# EAGLE design Esquematico (EAGLE 9.6.2)
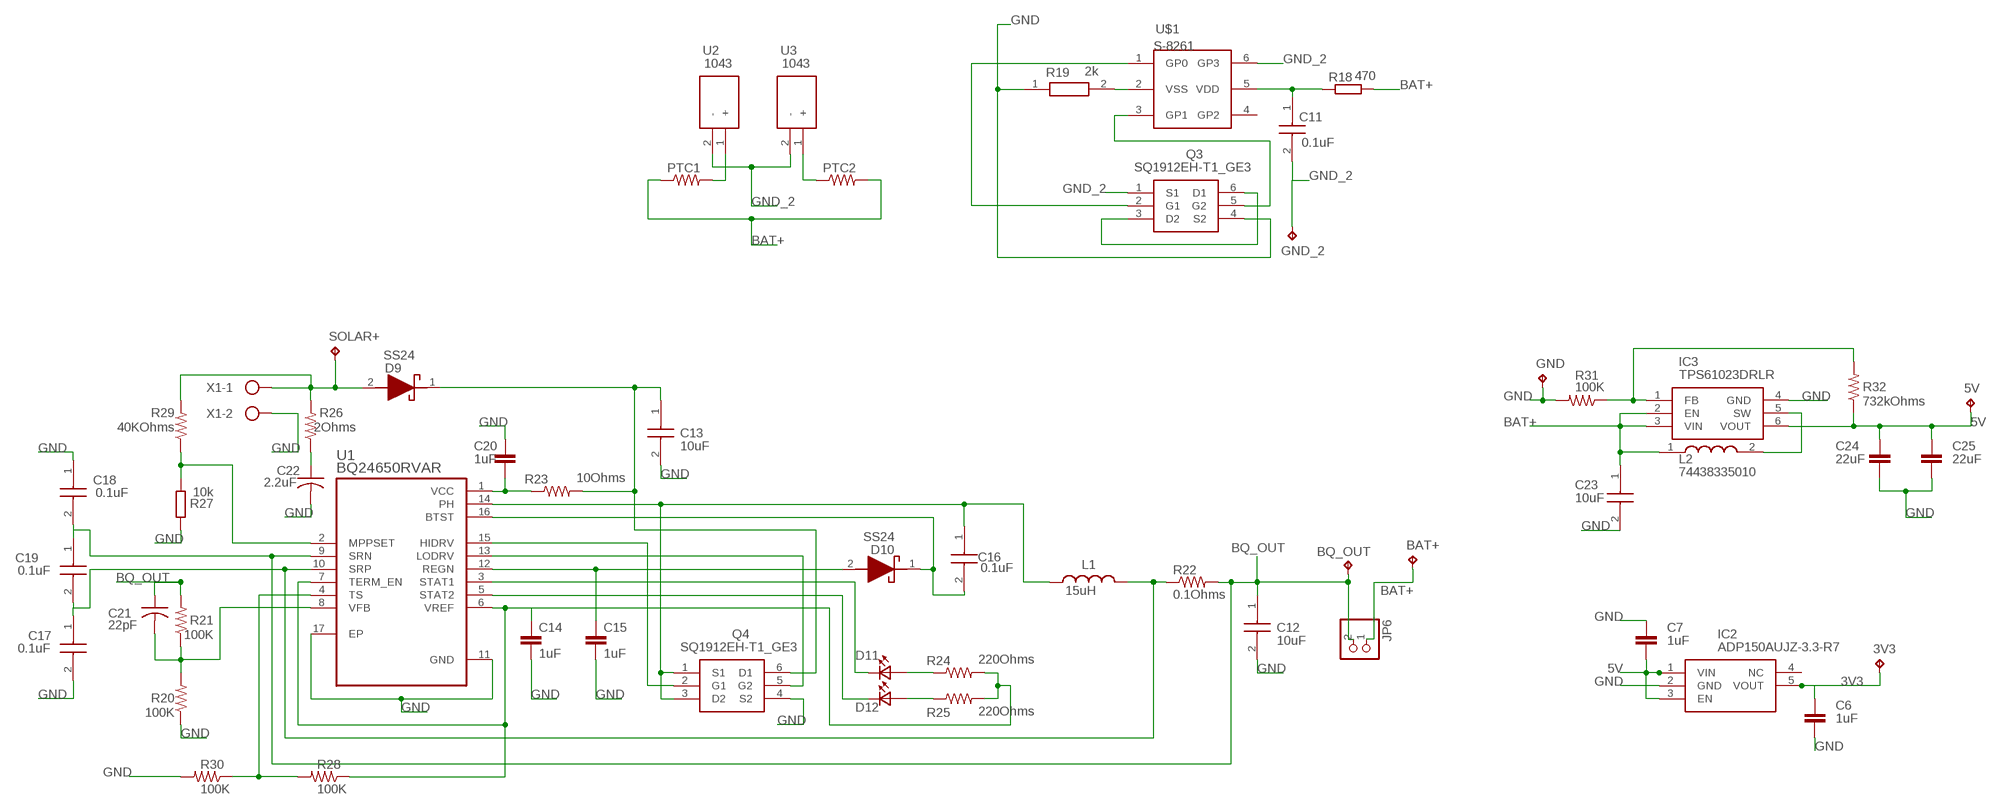
[diagram p0: schematic, sheet 1, part 1 of 2]
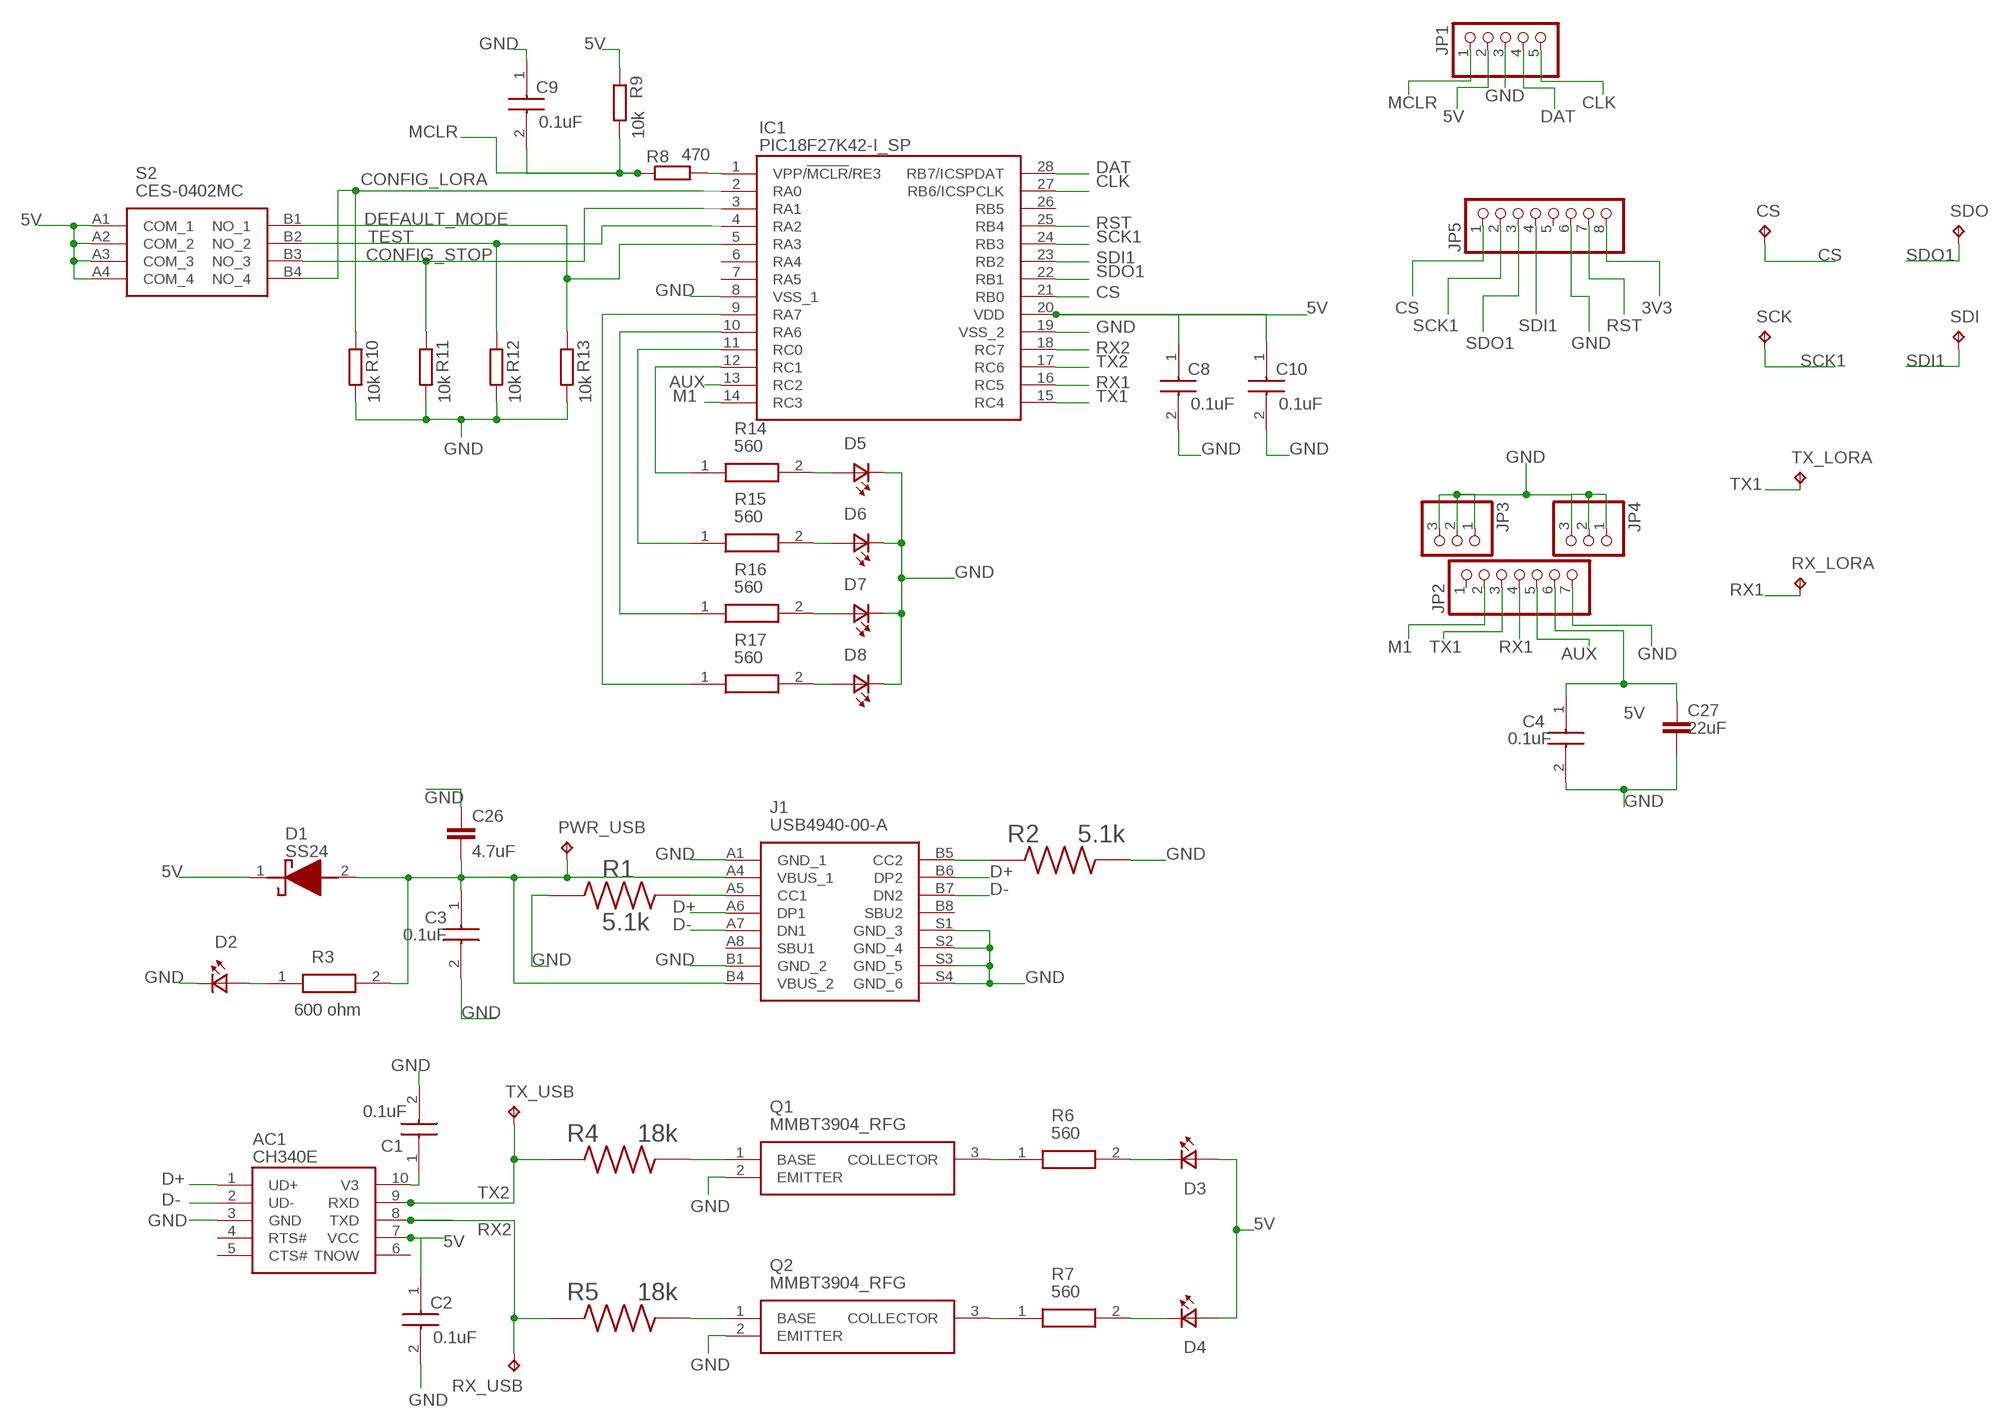
[diagram p1: schematic, sheet 1, part 2 of 2]

## Parts
3V3  TPB1,27  [B1,27]
5V  TPB1,27  [B1,27]
AC1  CH340E  [SOP50P490X100-10N]
BAT+  TPB1,27  [B1,27]
BQ_OUT  TPB1,27  [B1,27]
C1  0.1uF  GRM022C81A104ME05L  [CAPC0402X22N]
C2  0.1uF  GRM022C81A104ME05L  [CAPC0402X22N]
C3  0.1uF  GRM022C81A104ME05L  [CAPC0402X22N]
C4  0.1uF  GRM022C81A104ME05L  [CAPC0402X22N]
C6  1uF  C-EUC0805K  [C0805K]
C7  1uF  C-EUC0805K  [C0805K]
C8  0.1uF  GRM022C81A104ME05L  [CAPC0402X22N]
C9  0.1uF  GRM022C81A104ME05L  [CAPC0402X22N]
C10  0.1uF  GRM022C81A104ME05L  [CAPC0402X22N]
C11  0.1uF  GRM022C81A104ME05L  [CAPC0402X22N]
C12  10uF  0805X7R106KT1AT  [CAPC2013X113N]
C13  10uF  0805X7R106KT1AT  [CAPC2013X113N]
C14  1uF  C-EUC0805K  [C0805K]
C15  1uF  C-EUC0805K  [C0805K]
C16  0.1uF  GRM022C81A104ME05L  [CAPC0402X22N]
C17  0.1uF  GRM022C81A104ME05L  [CAPC0402X22N]
C18  0.1uF  GRM022C81A104ME05L  [CAPC0402X22N]
C19  0.1uF  GRM022C81A104ME05L  [CAPC0402X22N]
C20  1uF  C-EUC0805K  [C0805K]
C21  22pF  C-USC0603  [C0603]
C22  2.2uF  C-USC0603  [C0603]
C23  10uF  0805X7R106KT1AT  [CAPC2013X113N]
C24  22uF  C-EUC1210K  [C1210K]
C25  22uF  C-EUC1210K  [C1210K]
C26  4.7uF  C-EUC0402  [C0402]
C27  22uF  C-EUC1210K  [C1210K]
CS  TPB1,27  [B1,27]
D1  SS24  [DIOM5436X247N]
D2  LTST-C193KGKT-5A  [0603]
D3  LTST-C193KGKT-5A  [0603]
D4  LTST-C193KGKT-5A  [0603]
D5  LTST-C193KGKT-5A  [0603]
D6  LTST-C193KGKT-5A  [0603]
D7  LTST-C193KGKT-5A  [0603]
D8  LTST-C193KGKT-5A  [0603]
D9  SS24  [DIOM5436X247N]
D10  SS24  [DIOM5436X247N]
D11  LTST-C193KGKT-5A  [0603]
D12  LTST-C193KGKT-5A  [0603]
GND  TPB1,27  [B1,27]
GND_2  TPB1,27  [B1,27]
IC1  PIC18F27K42-I_SP  [DIP794W56P254L3486H508Q28N]
IC2  ADP150AUJZ-3.3-R7  [SOT95P280X100-5N]
IC3  TPS61023DRLR  [SOTFL50P160X60-6N]
J1  USB4940-00-A  [USB494000A]
JP1  PINHD-1X5  [1X05]
JP2  PINHD-1X7  [1X07]
JP3  PINHD-1X3  [1X03]
JP4  PINHD-1X3  [1X03]
JP5  PINHD-1X8  [1X08]
JP6  PINHD-1X2  [1X02]
L1  15uH  WE-PD2A_7850_784775115  [WE-PD2A_7850]
L2  74438335010  [INDPM3030X150N]
PTC1  R-US_R0603  [R0603]
PTC2  R-US_R0603  [R0603]
PWR_USB  TPB1,27  [B1,27]
Q1  MMBT3904_RFG  [SOT95P237X112-3N]
Q2  MMBT3904_RFG  [SOT95P237X112-3N]
Q3  SQ1912EH-T1_GE3  [SQ1912EHT1_GE3]
Q4  SQ1912EH-T1_GE3  [SQ1912EHT1_GE3]
R1  5.1k  SR0603KR-075K1L  [RESC1608X55N]
R2  5.1k  SR0603KR-075K1L  [RESC1608X55N]
R3  600 ohm  CRCW0805600RFKEAHP  [RESC2012X60N]
R4  18k  ERJ-P03F1802V  [RESC1608X55N]
R5  18k  ERJ-P03F1802V  [RESC1608X55N]
R6  560  CRCW0603560RFKED  [RESC1608X50N]
R7  560  CRCW0603560RFKED  [RESC1608X50N]
R8  470  R-EU_R1206  [R1206]
R9  10k  R-EU_R1206  [R1206]
R10  10k  R-EU_R1206  [R1206]
R11  10k  R-EU_R1206  [R1206]
R12  10k  R-EU_R1206  [R1206]
R13  10k  R-EU_R1206  [R1206]
R14  560  CRCW0603560RFKED  [RESC1608X50N]
R15  560  CRCW0603560RFKED  [RESC1608X50N]
R16  560  CRCW0603560RFKED  [RESC1608X50N]
R17  560  CRCW0603560RFKED  [RESC1608X50N]
R18  470  R-EU_R1206  [R1206]
R19  2k  CRCW06032K00JNTA  [RESC1608X50N]
R20  100K  R-US_R0402  [R0402]
R21  100K  R-US_R0402  [R0402]
R22  0.1Ohms  R-US_R0805  [R0805]
R23  10Ohms  R-US_R1206W  [R1206W]
R24  220Ohms  R-US_R0402  [R0402]
R25  220Ohms  R-US_R0402  [R0402]
R26  2Ohms  R-US_R2512W  [R2512W]
R27  10k  R-EU_R1206  [R1206]
R28  100K  R-US_R0402  [R0402]
R29  40KOhms  R-US_R0805  [R0805]
R30  100K  R-US_R0402  [R0402]
R31  100K  R-US_R0402  [R0402]
R32  732kOhms  R-US_R0402  [R0402]
RX_LORA  TPB1,27  [B1,27]
RX_USB  TPB1,27  [B1,27]
S2  CES-0402MC  [CES0402MC]
SCK  TPB1,27  [B1,27]
SDI  TPB1,27  [B1,27]
SDO  TPB1,27  [B1,27]
SOLAR+  TPB1,27  [B1,27]
TX_LORA  TPB1,27  [B1,27]
TX_USB  TPB1,27  [B1,27]
U1  BQ24650RVAR  [QFN50P350X350X100-17N]
U2  1043  [1043]
U3  1043  [1043]
U$1  S-8261  10F200T  [SOT23-6]
X1  V+  W237-102  [W237-102]

## Nets
3V3: 3V3.TP C6.1 IC2.5(VOUT) JP5.8
5V: 5V.TP AC1.7(VCC) C2.1 C4.1 C7.2 C8.1 C10.1 C24.1 C25.1 C27.1 D1.1(K) D3.2(A2) D4.2(A2) IC1.20(VDD) IC2.1(VIN) IC2.3(EN) IC3.6(VOUT) JP1.2 JP2.6 R9.1 R32.1 S2.A1(COM_1) S2.A2(COM_2) S2.A3(COM_3) S2.A4(COM_4)
AUX: IC1.13(RC2) JP2.5
BAT+: BAT+.TP C23.1 IC3.2(EN) IC3.3(VIN) JP6.1 L2.1 PTC1.1 PTC2.2 R18.2
BQ_OUT: BQ_OUT.TP C12.1 C18.2 C19.1 C21.1 JP6.2 R21.2 R22.2 U1.9(SRN)
CLK: IC1.27(RB6/ICSPCLK) JP1.5
CONFIG_LORA: IC1.2(RA0) R10.1 S2.B4(NO_4)
CONFIG_STOP: IC1.3(RA1) R11.1 S2.B3(NO_3)
CS: CS.TP IC1.21(RB0) JP5.1
D+: AC1.1(UD+) J1.A6(DP1) J1.B6(DP2)
D-: AC1.2(UD-) J1.A7(DN1) J1.B7(DN2)
DAT: IC1.28(RB7/ICSPDAT) JP1.4
DEFAULT_MODE: IC1.5(RA3) R13.1 S2.B1(NO_1)
GND: AC1.3(GND) C1.2 C2.2 C3.2 C4.2 C6.2 C7.1 C8.2 C9.1 C10.2 C12.2 C13.2 C14.2 C15.2 C17.2 C18.1 C20.1 C22.2 C23.2 C24.2 C25.2 C26.1 C27.2 D2.1(K2) D5.1(K2) D6.1(K2) D7.1(K2) D8.1(K2) GND.TP IC1.8(VSS_1) IC1.19(VSS_2) IC2.2(GND) IC3.4(GND) J1.A1(GND_1) J1.B1(GND_2) J1.S1(GND_3) J1.S2(GND_4) J1.S3(GND_5) J1.S4(GND_6) JP1.3 JP2.7 JP3.1 JP3.2 JP3.3 JP4.1 JP4.2 JP4.3 JP5.6 Q1.2(EMITTER) Q2.2(EMITTER) Q3.4(S2) Q4.4(S2) R1.1 R2.2 R10.2 R11.2 R12.2 R13.2 R19.1 R20.1 R27.1 R30.2 R31.2 U1.11(GND) U1.17(EP) X1.2
GND_2: C11.2 GND_2.TP Q3.1(S1) U2.2(-) U3.2(-) U$1.6(GP3)
M1: IC1.14(RC3) JP2.2
MCLR: C9.2 JP1.1 R8.1 R9.2
N$1: J1.A5(CC1) R1.2
N$2: Q1.1(BASE) R4.2
N$3: C3.1 C26.2 D1.2(A) J1.A4(VBUS_1) J1.B4(VBUS_2) PWR_USB.TP R3.2
N$4: J1.B5(CC2) R2.1
N$6: D2.2(A2) R3.1
N$7: AC1.10(V3) C1.1
N$8: Q2.1(BASE) R5.2
N$9: IC1.9(RA7) R17.1
N$10: IC1.10(RA6) R16.1
N$11: Q1.3(COLLECTOR) R6.1
N$12: IC1.11(RC0) R15.1
N$13: IC1.12(RC1) R14.1
N$14: Q2.3(COLLECTOR) R7.1
N$15: D3.1(K2) R6.2
N$16: D4.1(K2) R7.2
N$17: IC1.1(VPP/!MCLR!/RE3) R8.2
N$18: Q3.2(G1) U$1.1(GP0)
N$19: D5.2(A2) R14.2
N$20: D6.2(A2) R15.2
N$21: D7.2(A2) R16.2
N$22: D8.2(A2) R17.2
N$23: C11.1 R18.1 U$1.5(VDD)
N$24: Q3.5(G2) U$1.3(GP1)
N$25: Q3.3(D2) Q3.6(D1)
N$26: C20.2 R23.1 U1.1(VCC)
N$27: R19.2 U$1.2(VSS)
N$28: C16.1 L1.1 Q4.1(S1) Q4.3(D2) U1.14(PH)
N$29: C17.1 C19.2 L1.2 R22.1 U1.10(SRP)
N$30: C14.1 R24.2 R25.2 R28.1 U1.6(VREF) U1.7(TERM_EN)
N$31: R27.2 R29.1 U1.2(MPPSET)
N$32: R28.2 R30.1 U1.4(TS)
N$33: C16.2 D10.1(K) U1.16(BTST)
N$34: C21.2 R20.2 R21.1 U1.8(VFB)
N$35: C13.1 D9.1(K) Q4.6(D1) R23.2
N$36: D9.2(A) R26.2 R29.2 SOLAR+.TP X1.1
N$37: C22.1 R26.1
N$38: D11.2(A2) R24.1
N$39: D12.2(A2) R25.1
N$40: D11.1(K2) U1.3(STAT1)
N$41: D12.1(K2) U1.5(STAT2)
N$42: C15.1 D10.2(A) U1.12(REGN)
N$43: Q4.2(G1) U1.15(HIDRV)
N$44: Q4.5(G2) U1.13(LODRV)
N$45: PTC1.2 U2.1(+)
N$46: PTC2.1 U3.1(+)
N$47: IC3.5(SW) L2.2
N$48: IC3.1(FB) R31.1 R32.2
RST: IC1.25(RB4) JP5.7
RX1: IC1.16(RC5) JP2.4 RX_LORA.TP
RX2: AC1.8(TXD) IC1.18(RC7) R5.1 RX_USB.TP
SCK1: IC1.24(RB3) JP5.2 SCK.TP
SDI1: IC1.23(RB2) JP5.4 SDI.TP
SDO1: IC1.22(RB1) JP5.3 SDO.TP
TEST: IC1.4(RA2) R12.1 S2.B2(NO_2)
TX1: IC1.15(RC4) JP2.3 TX_LORA.TP
TX2: AC1.9(RXD) IC1.17(RC6) R4.1 TX_USB.TP
Unconnected: AC1.4(RTS#) AC1.5(CTS#) AC1.6(TNOW) IC1.6(RA4) IC1.7(RA5) IC1.26(RB5) IC2.4(NC) J1.A8(SBU1) J1.B8(SBU2) JP2.1 JP5.5 U$1.4(GP2)

## Library data of the parts
3V3 5V BAT+ BQ_OUT CS GND GND_2 PWR_USB RX_LORA RX_USB SCK SDI SDO SOLAR+ TX_LORA TX_USB = testpad:TP: Test pad
AC1 = CH340E:CH340E: USB Serial IC Source: Datasheet <https://akizukidenshi.com/download/ds/wch/ch340.pdf>; DESCRIPTION: USB Serial IC; HEIGHT: 1mm; MANUFACTURER_NAME: WCH; MANUFACTURER_PART_NUMBER: CH340E
C1-C4 C8-C11 C16-C19 = GRM022C81A104ME05L:GRM022C81A104ME05L: 0.1 F +/-20% 10V Ceramic Capacitor X6S 01005 (0402 Metric) Source: Datasheet <https://pim.murata.com/en-eu/pim/details/?partNum=GRM022C81A104ME05#>; DESCRIPTION: 0.1 F +/-20% 10V Ceramic Capacitor X6S 01005 (0402 Metric); HEIGHT: 0.22mm; MANUFACTURER_NAME: Murata Electronics; MANUFACTURER_PART_NUMBER: GRM022C81A104ME05L
C6 C7 C14 C15 C20 C24-C27 = rcl:C-EU: CAPACITOR, European symbol; SPICEPREFIX: C
C12 C13 C23 = 0805X7R106KT1AT:0805X7R106KT1AT: Multilayer Ceramic Capacitors MLCC - SMD/SMT CAP-RESALE Source: Datasheet <https://datasheets.kyocera-avx.com/Accu-P.pdf>; DESCRIPTION: Multilayer Ceramic Capacitors MLCC - SMD/SMT CAP-RESALE; HEIGHT: 1.13mm; MANUFACTURER_NAME: Kyocera AVX; MANUFACTURER_PART_NUMBER: 0805X7R106KT1AT; MOUSER_PART_NUMBER: 581-0805X7R106KT1AT; MOUSER_PRICE-STOCK: https://www.mouser.co.uk/ProductDetail/KYOCERA-AVX/0805X7R106KT1AT?qs=XAiT9M5g4x%252Bo4s7i6ql7Og%3D%3D
C21 C22 = rcl:C-US: CAPACITOR, American symbol; SPICEPREFIX: C
D1 D9 D10 = SS24:SS24: TAIWAN SEMICONDUCTOR - SS24 - SCHOTTKY RECTIFIER, 2A, 40V, DO-214AA Source: Datasheet <https://www.onsemi.com/pub/Collateral/SS24-D.PDF>; DESCRIPTION: TAIWAN SEMICONDUCTOR - SS24 - SCHOTTKY RECTIFIER, 2A, 40V, DO-214AA; HEIGHT: 2.47mm; MANUFACTURER_NAME: Taiwan Semiconductor; MANUFACTURER_PART_NUMBER: SS24; MOUSER_PART_NUMBER: 821-SS24; MOUSER_PRICE-STOCK: https://www.mouser.co.uk/ProductDetail/Taiwan-Semiconductor/SS24?qs=JV7lzlMm3yKXRBg9WjRCYA%3D%3D
D2-D8 D11 D12 = LTST-C193KGKT-5A:LTST-C193KGKT-5A: Check availability <https://pricing.snapeda.com/parts/LTST-C193KGKT-5A/Lite-On%20Inc./view-part?ref=eda>; AVAILABILITY: In Stock; CHECK_PRICES: https://www.snapeda.com/parts/LTST-C193KGKT-5A/Lite-On/view-part/?ref=eda; DESCRIPTION: Green 572nm LED Indication - Discrete 2V 0603 (1608 Metric); MF: Lite-On Inc.; MP: LTST-C193KGKT-5A; PACKAGE: 0603 Lite-On; PRICE: None; SNAPEDA_LINK: https://www.snapeda.com/parts/LTST-C193KGKT-5A/Lite-On/view-part/?ref=snap
IC1 = PIC18F27K42-I_SP:PIC18F27K42-I_SP: MICROCHIP - PIC18F27K42-I/SP - MCU, 8BIT, PIC18, 64MHZ, DIP-28 Source: Datasheet <http://ww1.microchip.com/downloads/en/DeviceDoc/PIC18LF26-27-45-46-47-55-56-57K42-Data-Sheet-40001919C.pdf>; DESCRIPTION: MICROCHIP - PIC18F27K42-I/SP - MCU, 8BIT, PIC18, 64MHZ, DIP-28; HEIGHT: 5.08mm; MANUFACTURER_NAME: Microchip; MANUFACTURER_PART_NUMBER: PIC18F27K42-I/SP; MOUSER_PART_NUMBER: 579-PIC18F27K42-I/SP; MOUSER_PRICE-STOCK: https://www.mouser.co.uk/ProductDetail/Microchip-Technology/PIC18F27K42-I-SP?qs=f9yNj16SXrKAX6YAj6JaEQ%3D%3D
IC2 = ADP150AUJZ-3.3-R7:ADP150AUJZ-3.3-R7: Ultralow Noise, 150 mA CMOS Linear Regulator Source: Datasheet <https://componentsearchengine.com/Datasheets/1/ADP150AUJZ-3.3-R7.pdf>; DESCRIPTION: Ultralow Noise, 150 mA CMOS Linear Regulator; HEIGHT: 1mm; MANUFACTURER_NAME: Analog Devices; MANUFACTURER_PART_NUMBER: ADP150AUJZ-3.3-R7; MOUSER_PART_NUMBER: N/A; MOUSER_PRICE-STOCK: https://www.mouser.com/Search/Refine.aspx?Keyword=N%2FA
IC3 = TPS61023DRLR:TPS61023DRLR: Switching Voltage Regulators 3-A boost converter with 0.5-V ultra-low input voltage 6-SOT-5X3 -40 to 125 Source: Datasheet <http://www.ti.com/lit/ds/symlink/tps61023.pdf>; DESCRIPTION: Switching Voltage Regulators 3-A boost converter with 0.5-V ultra-low input voltage 6-SOT-5X3 -40 to 125; HEIGHT: 0.6mm; MANUFACTURER_NAME: Texas Instruments; MANUFACTURER_PART_NUMBER: TPS61023DRLR; MOUSER_PART_NUMBER: 595-TPS61023DRLR; MOUSER_PRICE-STOCK: https://www.mouser.co.uk/ProductDetail/Texas-Instruments/TPS61023DRLR?qs=BJlw7L4Cy7%2FfEnwYuWeGOg%3D%3D
J1 = USB4940-00-A:USB4940-00-A: USB-C (USB TYPE-C) USB 2.0 Receptacle Connector 24 (16+8 Dummy) Position Surface Mount, Right Angle , 48VDC , -40C ~ 85C Source: Datasheet <https://gct.co/download?type=PDFDrawing&name=USB4940.pdf>; DESCRIPTION: USB-C (USB TYPE-C) USB 2.0 Receptacle Connector 24 (16+8 Dummy) Position Surface Mount, Right Angle , 48VDC , -40C ~ 85C; HEIGHT: 3.46mm; MANUFACTURER_NAME: GCT (GLOBAL CONNECTOR TECHNOLOGY); MANUFACTURER_PART_NUMBER: USB4940-00-A
JP1 = pinhead:PINHD-1X5: PIN HEADER
JP2 = pinhead:PINHD-1X7: PIN HEADER
JP3 JP4 = pinhead:PINHD-1X3: PIN HEADER
JP5 = pinhead:PINHD-1X8: PIN HEADER
JP6 = pinhead:PINHD-1X2: PIN HEADER
L1 = Eagle_WE-PD2A (rev19a):WE-PD2A_7850: WE-PD2A SMD Power Inductor Characteristics Open size / unshielded Saturation currents up to 15 A Low tolerances at high inductance values Operating temperature: -40°C to +125°C Applications Integrated DC/DC-converter Switching regulators with low operating voltage Perfectly suitable for switching regulators with extremely high efficiency Optimal attenuation in MHz frequency range <https://katalog.we-online.de/media/images/v2/o14829v209%20Family_WE-PD2A.jpg> Details see: https://katalog.we-online.de/en/am/WE-PD2A Updated by Ella Wu 2019-09-10 2019(C) Wurth Elektronik; DATASHEET-URL: https://katalog.we-online.de/am/datasheet/784775115.pdf; FRES: 18MHz; IR: 1.93A; ISAT: 2.2A; MOUNT: SMT; PART-NUMBER: 784775115; RDC: 0.09Ohm
L2 = 74438335010:74438335010: WE-MAPI SMT Power Inductor Size 3015; L = 1 H +/-20%; IR = 4.95 A; Isat = 5.95 A; RDCmax = 47 m Source: Datasheet <https://www.we-online.com/catalog/datasheet/74438335010.pdf>; DESCRIPTION: WE-MAPI SMT Power Inductor Size 3015; L = 1 H +/-20%; IR = 4.95 A; Isat = 5.95 A; RDCmax = 47 m; HEIGHT: 1.5mm; MANUFACTURER_NAME: Wurth Elektronik; MANUFACTURER_PART_NUMBER: 74438335010; MOUSER_PART_NUMBER: 710-74438335010; MOUSER_PRICE-STOCK: https://www.mouser.co.uk/ProductDetail/Wurth-Elektronik/74438335010?qs=ZB8tH5z5N7bHVtgtnUbuDw%3D%3D
PTC1 PTC2 R20-R26 R28-R32 = rcl:R-US_: RESISTOR, American symbol; SPICEPREFIX: R
Q1 Q2 = MMBT3904_RFG:MMBT3904_RFG: Bipolar Transistors - BJT 60V, 0.2A, NPN Bipolar Transistor Source: Datasheet <https://www.mouser.ph/ProductDetail/Taiwan-Semiconductor/MMBT3904-RFG?qs=%2BEew9%2B0nqrDL0sX3Ji%2BWuA==&srsltid=AfmBOorDMGHclCCbzr-YwlweWENRMARJ-snV1LHfUeQztDY3ZWs3t7kd>; DESCRIPTION: Bipolar Transistors - BJT 60V, 0.2A, NPN Bipolar Transistor; HEIGHT: 1.12mm; MANUFACTURER_NAME: Taiwan Semiconductor; MANUFACTURER_PART_NUMBER: MMBT3904 RFG; MOUSER_PART_NUMBER: 821-MMBT3904RFG; MOUSER_PRICE-STOCK: https://www.mouser.co.uk/ProductDetail/Taiwan-Semiconductor/MMBT3904-RFG?qs=%252BEew9%252B0nqrDL0sX3Ji%252BWuA%3D%3D
Q3 Q4 = SQ1912EH-T1_GE3:SQ1912EH-T1_GE3: MOSFET 20V Vds 0.8A Id AEC-Q101 Qualified Source: Datasheet <https://www.vishay.com/doc?67394>; DESCRIPTION: MOSFET 20V Vds 0.8A Id AEC-Q101 Qualified; HEIGHT: 1.1mm; MANUFACTURER_NAME: Vishay; MANUFACTURER_PART_NUMBER: SQ1912EH-T1_GE3; MOUSER_PART_NUMBER: 78-SQ1912EH-T1_GE3; MOUSER_PRICE-STOCK: https://www.mouser.co.uk/ProductDetail/Vishay-Siliconix/SQ1912EH-T1_GE3?qs=4pzlT8jjbhflabtcF6PTMA%3D%3D
R1 R2 = SR0603KR-075K1L:SR0603KR-075K1L: Check availability <https://pricing.snapeda.com/parts/SR0603KR-075K1L/Yageo/view-part?ref=eda>; AVAILABILITY: In Stock; CHECK_PRICES: https://www.snapeda.com/parts/SR0603KR-075K1L/Yageo/view-part/?ref=eda; DESCRIPTION: 0603 (1608), 5,100 Ohms , 10% Tolerance, 1/10 (0.1) W; MF: Yageo; MP: SR0603KR-075K1L; PACKAGE: 1608 Yageo; PRICE: None; PURCHASE-URL: https://www.snapeda.com/api/url_track_click_mouser/?unipart_id=3880033&manufacturer=Yageo&part_name=SR0603KR-075K1L&search_term=sr0603kr-075k1l; SNAPEDA_LINK: https://www.snapeda.com/parts/SR0603KR-075K1L/Yageo/view-part/?ref=snap
R3 = CRCW0805600RFKEAHP:CRCW0805600RFKEAHP: Thick Film Resistors - SMD 600ohm 1% 100ppm Source: Datasheet <https://componentsearchengine.com/Datasheets/1/CRCW08051R00FKEAHP.pdf>; DESCRIPTION: Thick Film Resistors - SMD 600ohm 1% 100ppm; HEIGHT: 0.6mm; MANUFACTURER_NAME: Vishay; MANUFACTURER_PART_NUMBER: CRCW0805600RFKEAHP; MOUSER_PART_NUMBER: 71-CRCW0805600RFKEAH; MOUSER_PRICE-STOCK: https://www.mouser.co.uk/ProductDetail/Vishay-Dale/CRCW0805600RFKEAHP?qs=u4fy%2FsgLU9PA95L6jOiSKA%3D%3D
R4 R5 = ERJ-P03F1802V:ERJ-P03F1802V: Check availability <https://pricing.snapeda.com/parts/ERJ-P03F1802V/Panasonic/view-part?ref=eda>; AVAILABILITY: In Stock; CHECK_PRICES: https://www.snapeda.com/parts/ERJ-P03F1802V/Panasonic/view-part/?ref=eda; DESCRIPTION: RESISTOR, THICK FILM, 18KOHM, 1%, 0603RESISTOR, THICK FILM, 18KOHM, 1%, 0603, FULL REEL Product Range:PANASONIC - ERJ Series; MF: Panasonic; MP: ERJ-P03F1802V; PACKAGE: 1608-2 Panasonic; PRICE: None; PURCHASE-URL: https://www.snapeda.com/api/url_track_click_mouser/?unipart_id=910717&manufacturer=Panasonic&part_name=ERJ-P03F1802V&search_term=erj-p03f1802v; SNAPEDA_LINK: https://www.snapeda.com/parts/ERJ-P03F1802V/Panasonic/view-part/?ref=snap
R6 R7 R14-R17 = CRCW0603560RFKED:CRCW0603560RFKED: Standard Thick Film Chip Resistors value 560R ohm. Source: Datasheet <http://www.vishay.com/docs/20035/dcrcwe3.pdf>; DESCRIPTION: Standard Thick Film Chip Resistors value 560R ohm.; HEIGHT: 0.5mm; MANUFACTURER_NAME: Vishay; MANUFACTURER_PART_NUMBER: CRCW0603560RFKED
R8-R13 R18 R27 = rcl:R-EU_: RESISTOR, European symbol; SPICEPREFIX: R
R19 = CRCW06032K00JNTA:CRCW06032K00JNTA: Thick Film Resistors - SMD 1/10watt 2.0Kohms 5% Source: Datasheet <http://www.vishay.com/docs/20035/dcrcwe3.pdf>; DESCRIPTION: Thick Film Resistors - SMD 1/10watt 2.0Kohms 5%; HEIGHT: 0.5mm; MANUFACTURER_NAME: Vishay; MANUFACTURER_PART_NUMBER: CRCW06032K00JNTA; MOUSER_PART_NUMBER: 71-CRCW0603J-2.0K; MOUSER_PRICE-STOCK: https://www.mouser.co.uk/ProductDetail/Vishay-Dale/CRCW06032K00JNTA?qs=j1P7zxt5OoOYzGFX0ue7Sw%3D%3D
S2 = CES-0402MC:CES-0402MC: DIP Switches / SIP Switches OFF-ON 4 position DIP switch, raised actuator, straight PC terminals, 100mA @ 6V DC, magazine packaging Source: Datasheet <https://www.nidec-copal-electronics.com/e/catalog/switch/ces.pdf>; DESCRIPTION: DIP Switches / SIP Switches OFF-ON 4 position DIP switch, raised actuator, straight PC terminals, 100mA @ 6V DC, magazine packaging; HEIGHT: 12.3mm; MANUFACTURER_NAME: Nidec Copal; MANUFACTURER_PART_NUMBER: CES-0402MC; MOUSER_PART_NUMBER: 229-CES-0402MC; MOUSER_PRICE-STOCK: https://www.mouser.co.uk/ProductDetail/Nidec-Components/CES-0402MC?qs=XeJtXLiO41Q05topIs8SoQ%3D%3D
U1 = BQ24650RVAR:BQ24650RVAR: Check availability <https://pricing.snapeda.com/parts/BQ24650RVAR/Texas%20Instruments/view-part?ref=eda>; AVAILABILITY: In Stock; CHECK_PRICES: https://www.snapeda.com/parts/BQ24650RVAR/Texas+Instruments/view-part/?ref=eda; DESCRIPTION: Standalone 1-6 cell Buck battery charge controller with solar input and integrated MPPT; MF: Texas Instruments; MP: BQ24650RVAR; PACKAGE: VQFN-16 Texas Instruments; PRICE: None; PURCHASE-URL: https://www.snapeda.com/api/url_track_click_mouser/?unipart_id=45813&manufacturer=Texas Instruments&part_name=BQ24650RVAR&search_term=bq24650rvar; SNAPEDA_LINK: https://www.snapeda.com/parts/BQ24650RVAR/Texas+Instruments/view-part/?ref=snap
U2 U3 = 1043:1043: KEYSTONE - 1043 - BATTERY HOLDER, 18650, TH Source: Datasheet <http://www.keyelco.com/product-pdf.cfm?p=919>; DESCRIPTION: KEYSTONE - 1043 - BATTERY HOLDER, 18650, TH; HEIGHT: mm; MANUFACTURER_NAME: Keystone Electronics; MANUFACTURER_PART_NUMBER: 1043; MOUSER_PART_NUMBER: 534-1043; MOUSER_PRICE-STOCK: https://www.mouser.co.uk/ProductDetail/Keystone-Electronics/1043?qs=%2F7TOpeL5Mz6j%2FnxeOA1rsg%3D%3D
U$1 = adafruit:10F200T: PIC10F200/202/204/206 Ultra-small 8-bit PIC micros in SOT-23-6 and SOIC
X1 = con-wago-500:W237-102: WAGO SCREW CLAMP; MPN: 237-102; OC_FARNELL: unknown; OC_NEWARK: 70K9898

## Module DX-LR03
Ports: M1(io)

### Library data of the parts

## Board
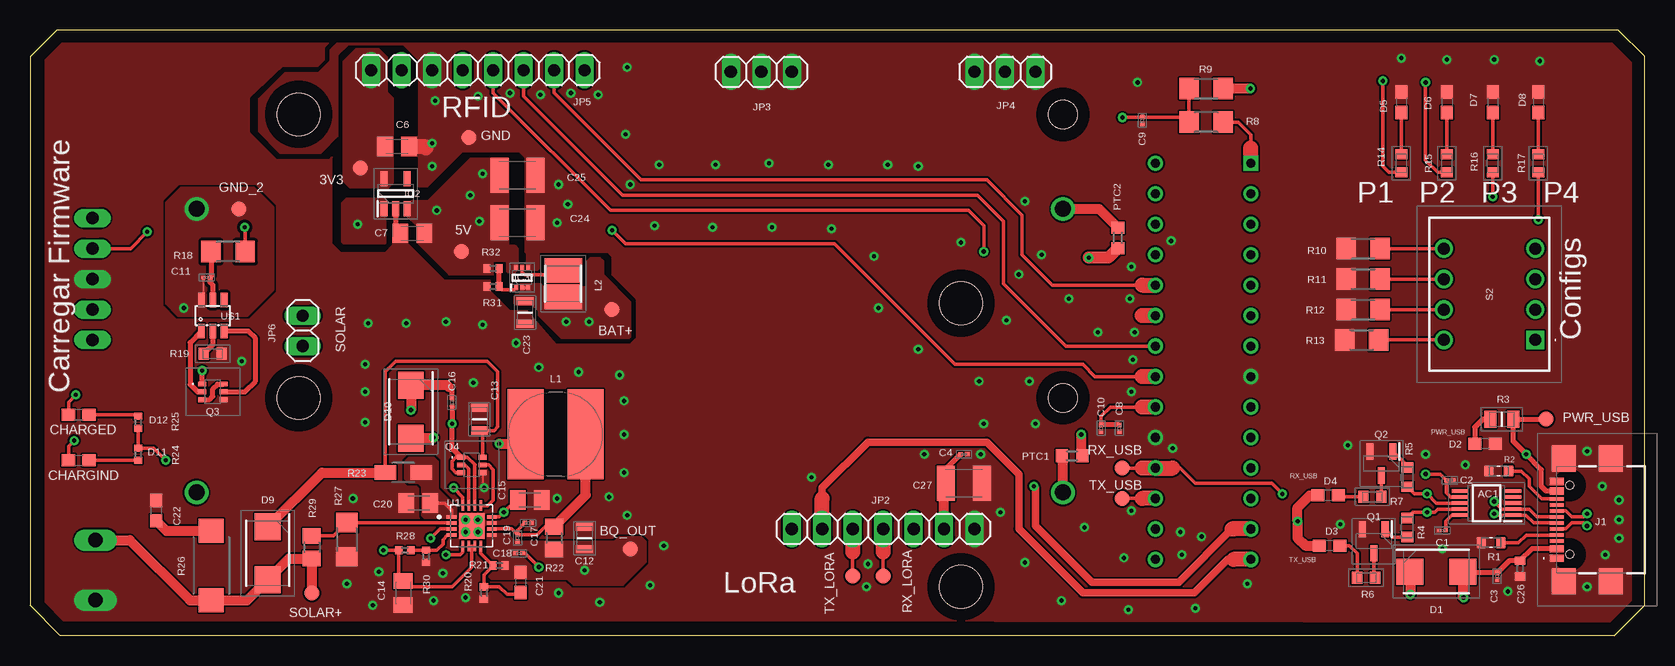
[diagram p2: board, top side]
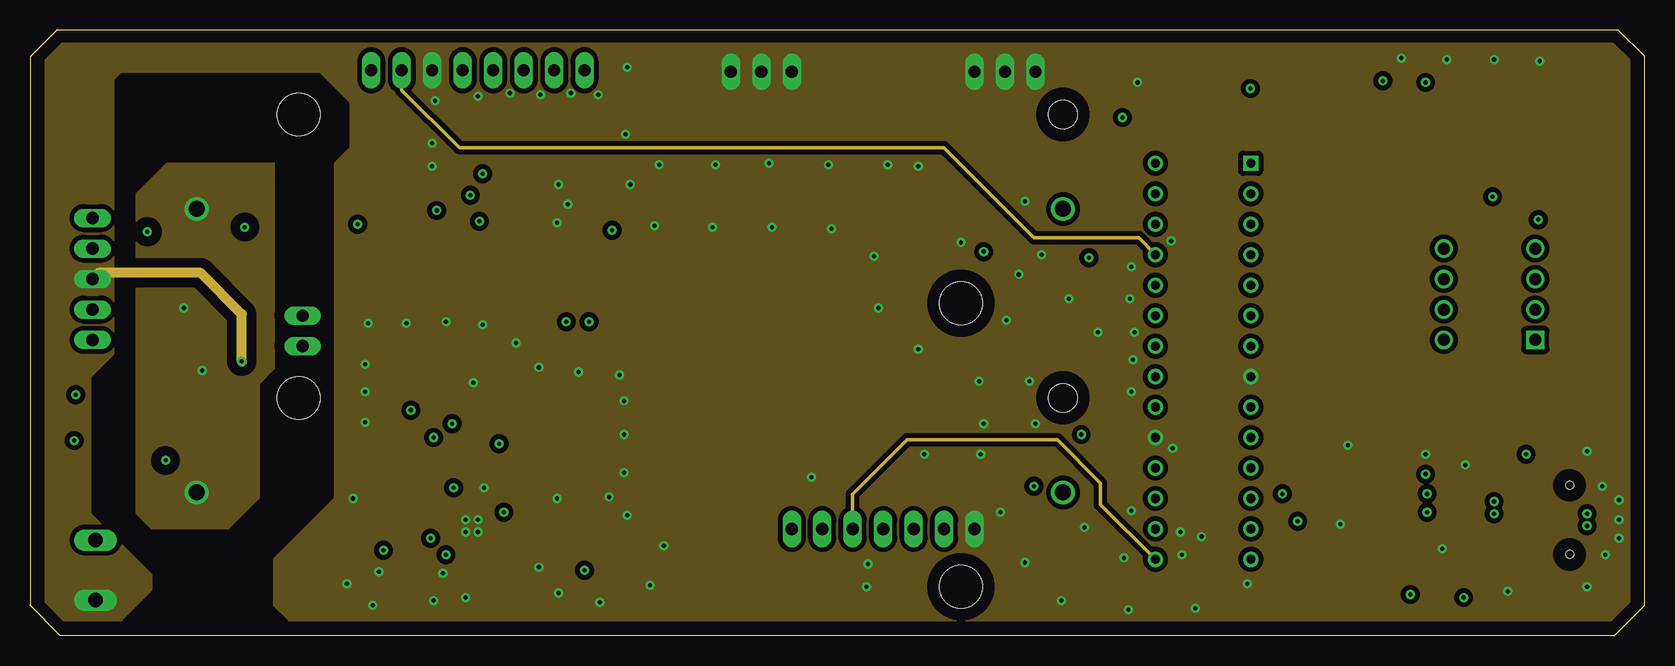
[diagram p3: board, inner layer GND]
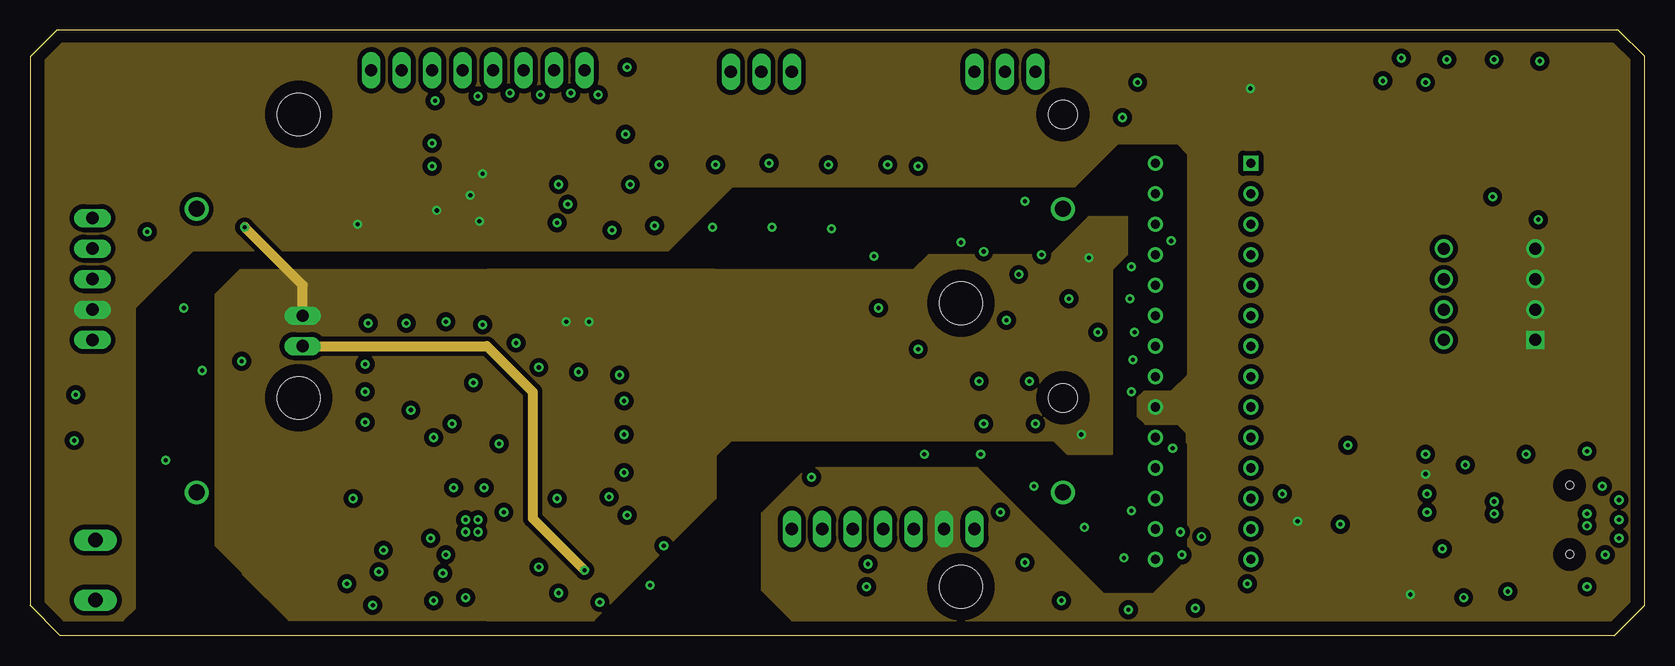
[diagram p4: board, inner layer 5v]
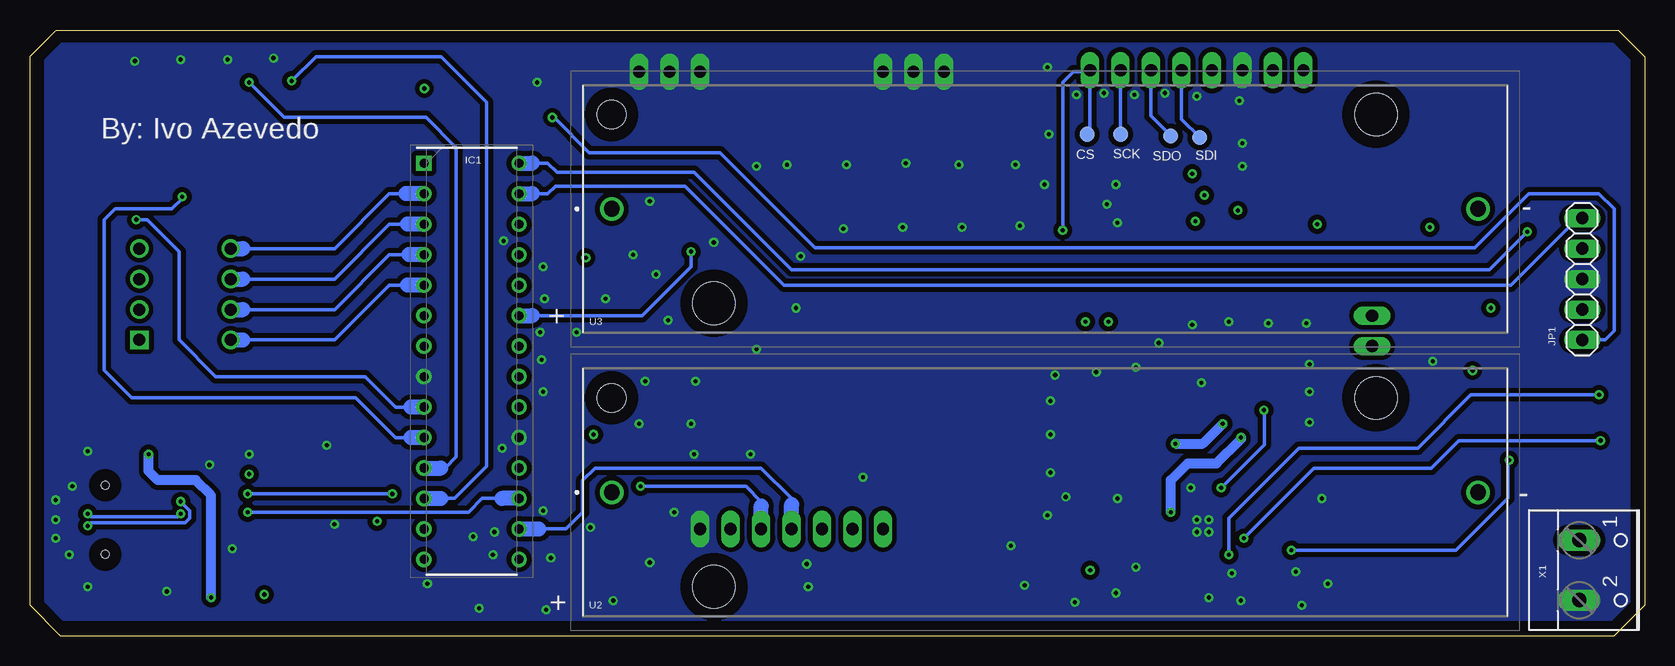
[diagram p5: board, bottom side, seen from below]

Size 134.6 x 50.47 mm. Coordinates in mm from the lower left corner, seen from the top.
Outline: 0,48.26 0,2.54 2.54,0 132.08,0 134.6,2.52 134.6,48.28 132.41,50.47 2.21,50.47 0,48.26
Copper layers (1+2*15+16): Top 0.035mm / dielectric 0.2104mm / GND 0.0152mm / dielectric 1.065mm / 5v 0.0152mm / dielectric 0.2104mm / Bottom 0.035mm
Design rules "default *": minimum track width 6mil, minimum drill 0.35mm, track to track 6mil, track to pad 6mil, pad to pad 6mil, via to via 6mil, smd to smd 6mil, copper to edge 40mil, drill to drill 6mil, minimum pad ring 10mil, minimum via ring 8mil, stop-mask expansion 4mil, vias tented up to drill 0mil, thermal gap 10mil

### Footprints (pad centres in the part's own frame; a part is rotated, then mirrored left to right if it is on the bottom)
B1,27 = smd 1.27 x 1.27: TP 0,0
SOP50P490X100-10N = smd 1.4 x 0.3: 1 -2.2,1; 2 -2.2,0.5; 3 -2.2,0; 4 -2.2,-0.5; 5 -2.2,-1; 6 2.2,-1; 7 2.2,-0.5; 8 2.2,0; 9 2.2,0.5; 10 2.2,1
CAPC0402X22N = smd 0.365 x 0.33: 1 -0.282,0; 2 0.282,0
C0805K = smd 1.3 x 1.6: 1 -1,0; 2 1,0
CAPC2013X113N = smd 0.67 x 1.41: 1 -0.94,0; 2 0.94,0
C0603 = smd 1.1 x 1: 1 -0.85,0; 2 0.85,0
C1210K = smd 1.5 x 2.9: 1 -1.5,0; 2 1.5,0
C0402 = smd 0.7 x 0.9: 1 -0.65,0; 2 0.65,0
DIOM5436X247N = smd 2.25 x 2.15: 1 -2.2,0; 2 2.2,0
0603 = smd 1.1 x 1: 1 -0.85,0; 2 0.85,0
DIP794W56P254L3486H508Q28N = drill 0.759 pad 1.159 square: 1 -3.969,16.51 | drill 0.759 pad 1.159: 2 -3.969,13.97; 3 -3.969,11.43; 4 -3.969,8.89; 5 -3.969,6.35; 6 -3.969,3.81; 7 -3.969,1.27; 8 -3.969,-1.27; 9 -3.969,-3.81; 10 -3.969,-6.35; 11 -3.969,-8.89; 12 -3.969,-11.43; 13 -3.969,-13.97; 14 -3.969,-16.51; 15 3.969,-16.51; 16 3.969,-13.97; 17 3.969,-11.43; 18 3.969,-8.89; 19 3.969,-6.35; 20 3.969,-3.81; 21 3.969,-1.27; 22 3.969,1.27; 23 3.969,3.81; 24 3.969,6.35; 25 3.969,8.89; 26 3.969,11.43; 27 3.969,13.97; 28 3.969,16.51
SOT95P280X100-5N = smd 1.25 x 0.6: 1 -1.25,0.95; 2 -1.25,0; 3 -1.25,-0.95; 4 1.25,-0.95; 5 1.25,0.95
SOTFL50P160X60-6N = smd 0.475 x 0.3: 1 -0.838,0.5; 2 -0.838,0; 3 -0.838,-0.5; 4 0.838,-0.5; 5 0.838,0; 6 0.838,0.5
USB494000A = smd 0.6 x 1.15: A1 -3.2,3.678; A4 -2.4,3.678; B1 3.2,3.678; B4 2.4,3.678 | smd 0.3 x 1.15: A5 -1.25,3.678; A6 -0.25,3.678; A7 0.25,3.678; A8 1.25,3.678; B5 1.75,3.678; B6 0.75,3.678; B7 -0.75,3.678; B8 -1.75,3.678 | smd 2.18 x 2: S1 -5.11,3.103; S2 5.11,3.103; S3 -5.11,-0.827; S4 5.11,-0.827 | hole 0.65: -2.89,2.603; 2.89,2.603
1X05 = drill 1.016 long: 1 -5.08,0; 2 -2.54,0; 3 0,0; 4 2.54,0; 5 5.08,0
1X07 = drill 1.016 long: 1 -7.62,0; 2 -5.08,0; 3 -2.54,0; 4 0,0; 5 2.54,0; 6 5.08,0; 7 7.62,0
1X03 = drill 1.016 long: 1 -2.54,0; 2 0,0; 3 2.54,0
1X08 = drill 1.016 long: 1 -8.89,0; 2 -6.35,0; 3 -3.81,0; 4 -1.27,0; 5 1.27,0; 6 3.81,0; 7 6.35,0; 8 8.89,0
1X02 = drill 1.016 long: 1 -1.27,0; 2 1.27,0
WE-PD2A_7850 = smd 3 x 7.5: 1 -2.5,0; 2 2.5,0
INDPM3030X150N = smd 2.05 x 3.1: 1 -1.1,0; 2 1.1,0
R0603 = smd 1 x 1.1: 1 -0.85,0; 2 0.85,0
SOT95P237X112-3N = smd 1.35 x 0.6: 1 -1,0.95; 2 -1,-0.95; 3 1,0
SQ1912EHT1_GE3 = smd 0.406 x 0.648: 1 -0.648,-0.895; 2 0,-0.895; 3 0.648,-0.895; 4 0.648,0.895; 5 0,0.895; 6 -0.648,0.895
RESC1608X55N = smd 0.79 x 0.93: 1 -0.82,0; 2 0.82,0
RESC2012X60N = smd 1 x 1.45: 1 -0.95,0; 2 0.95,0
RESC1608X55N' = smd 0.87 x 0.98: 1 -0.8,0; 2 0.8,0
RESC1608X50N = smd 0.85 x 1: 1 -0.75,0; 2 0.75,0
R1206 = smd 1.6 x 1.803: 1 -1.422,0; 2 1.422,0
R0402 = smd 0.6 x 0.7: 1 -0.5,0; 2 0.5,0
R0805 = smd 1.3 x 1.5: 1 -0.95,0; 2 0.95,0
R1206W = smd 1.8 x 1.2: 1 -1.499,0; 2 1.499,0
R2512W = smd 2 x 2.1: 1 -2.896,0; 2 2.896,0
CES0402MC = drill 1 pad 1.5 square: A1 0,0 | drill 1 pad 1.5: A2 2.54,0; A3 5.08,0; A4 7.62,0; B1 0,7.62; B2 2.54,7.62; B3 5.08,7.62; B4 7.62,7.62
QFN50P350X350X100-17N = smd 0.86 x 0.26: 1 -1.685,0.75; 2 -1.685,0.25; 3 -1.685,-0.25; 4 -1.685,-0.75; 9 1.685,-0.75; 10 1.685,-0.25; 11 1.685,0.25; 12 1.685,0.75 | smd 0.26 x 0.86: 5 -0.75,-1.685; 6 -0.25,-1.685; 7 0.25,-1.685; 8 0.75,-1.685; 13 0.75,1.685; 14 0.25,1.685; 15 -0.25,1.685; 16 -0.75,1.685 | smd 2.14 x 2.14: 17 0,0
1043 = drill 1.32 pad 1.98: 1 0,0; 2 -72.22,0 | hole 3.55: -63.71,-7.87; -8.51,7.87 | hole 2.39: 0,-7.87
SOT23-6 = smd 0.55 x 1.2: 1 -0.95,-1.3; 2 0,-1.3; 3 0.95,-1.3; 4 0.95,1.3; 5 0,1.3; 6 -0.95,1.3
W237-102 = drill 1.194 long: 1 -2.5,-1.27; 2 2.5,-1.27

### Placement (x,y rotation side)
3V3  27.56,38.99 0 top
5V  35.94,32 0 top
AC1  121.41,11.05 180 top
BAT+  48.51,27.18 0 top
BQ_OUT  50.04,7.24 0 top
C1  117.73,8.76 180 top
C2  118.36,12.95 0 top
C3  122.3,4.95 270 top
C4  77.85,15.11 0 top
C6  30.61,40.77 0 top
C7  31.88,33.53 0 top
C8  90.81,17.27 270 top
C9  92.71,42.93 90 top
C10  89.28,17.27 270 top
C11  14.73,29.84 180 top
C12  46.23,8.13 90 top
C13  37.47,18.03 90 top
C14  31.11,3.56 270 top
C15  41.66,11.3 0 top
C16  35.18,19.43 90 top
C17  41.53,9.4 0 top
C18  40.77,6.86 180 top
C19  40.64,8.13 90 top
C20  32.38,11.05 0 top
C21  40.89,4.45 270 top
C22  10.54,10.41 90 top
C23  41.27,26.92 270 top
C24  40.64,34.42 0 top
C25  40.64,38.35 0 top
C26  124.21,5.59 90 top
C27  77.85,12.7 0 top
CS  46.48,41.78 0 bottom
D1  117.22,5.33 0 top
D2  121.28,16 180 top
D3  108.33,7.49 180 top
D4  108.2,11.68 180 top
D5  114.3,44.45 270 top
D6  118.11,44.45 270 top
D7  121.92,44.45 270 top
D8  125.73,44.45 270 top
D9  19.81,6.86 270 top
D10  31.75,18.67 270 top
D11  4.06,14.61 0 top
D12  4.06,18.41 0 top
GND  36.58,41.53 0 top
GND_2  17.4,35.56 0 top
IC1  97.79,22.86 0 bottom
IC2  30.48,36.83 90 top
IC3  41.02,29.84 90 top
J1  130.94,9.65 90 top
JP1  5.21,29.72 90 bottom
JP2  71.12,8.89 0 top
JP3  60.96,46.99 0 top
JP4  81.28,46.99 0 top
JP5  37.34,47.12 180 top
JP6  22.73,25.4 270 top
L1  43.81,16.76 0 top
L2  44.45,29.34 90 top
PTC1  86.87,14.99 180 top
PTC2  90.68,33.15 270 top
PWR_USB  126.36,18.03 0 top
Q1  112.01,7.87 270 top
Q2  112.65,14.35 270 top
Q3  15.24,20.32 270 top
Q4  36.83,14.22 270 top
R1  121.79,7.75 0 top
R2  122.43,13.72 180 top
R3  122.68,18.03 0 top
R4  18k  [RESC1608X55N']  114.81,9.02 270 top
R5  18k  [RESC1608X55N']  114.81,13.21 90 top
R6  111.38,4.83 180 top
R7  111.89,11.56 180 top
R8  98.04,42.8 0 top
R9  98.04,45.59 180 top
R10  111.12,32.26 180 top
R11  111.12,29.72 180 top
R12  111.12,27.18 180 top
R13  111,24.64 180 top
R14  114.3,39.37 90 top
R15  118.11,39.37 90 top
R16  121.92,39.37 90 top
R17  125.73,39.37 90 top
R18  16.51,32 0 top
R19  15.24,23.5 180 top
R20  37.85,3.56 90 top
R21  39.12,5.84 0 top
R22  43.69,8.13 270 top
R23  31.11,13.59 180 top
R24  9.02,15.11 90 top
R25  9.02,17.78 270 top
R26  15.11,5.84 270 top
R27  26.42,8 90 top
R28  31.24,7.11 0 top
R29  23.5,7.37 270 top
R30  33.02,6.6 270 top
R31  38.61,29.08 180 top
R32  38.61,30.61 0 top
RX_LORA  71.12,4.95 0 top
RX_USB  91.06,13.97 0 top
S2  125.48,24.64 90 top
SCK  43.69,41.78 0 bottom
SDI  37.08,41.53 0 bottom
SDO  39.5,41.66 0 bottom
SOLAR+  23.5,3.56 0 top
TX_LORA  68.58,4.95 0 top
TX_USB  91.06,11.43 0 top
U1  36.83,9.14 0 top
U2  86.11,11.94 180 bottom
U3  86.11,35.56 180 bottom
U$1  15.24,26.67 0 top
X1  4.19,5.46 270 bottom

### Tracks (layer width: path | path; a pad name or v marks a point on that pad's centre or on a via)
3V3
  pour Top (no thermals): 29.72,48.26 29.72,45.34 30.23,44.83 30.23,37.72 29.84,37.34 26.67,37.34 26.16,37.85 26.16,47.88 27.18,48.9 29.08,48.9
5V  (via drill 0.35, 0.35 pad 0.45)
  Top 0.305: v116.33,13.46 117.57,13.46 C2.1 118.08,11.9 118.43,11.55 AC1.7 | C10.1 89.28,18.29 90.04,19.05 92.71,19.05
  Top 0.406: C8.1 C10.1 | C27.1 76.35,13.89 C4.1
  Top 0.813: v101.73,45.59 R9.1 | D1.1 115.06,5.29 v115.06,3.43 | D4.2 106.68,11.68 105.66,10.67 v105.66,9.53 105.66,8.13 106.3,7.49 D3.2 | JP2.6 76.2,12.55 C27.1
  Top 1.27: IC1.20 92.71,19.05
  other vias: 27.3,34.29 37.72,38.48 36.7,36.7 37.47,34.54 33.91,35.43
  pour 5v (isolate 0.406, no thermals): 13.59,32.13 53.21,32.13 58.55,37.47 87.12,37.47 90.68,41.02 95.63,41.02 96.52,40.13 96.52,6.35 93.6,3.43 89.53,3.43 78.99,13.97 64.77,13.97 60.96,10.16 60.96,3.81 63.5,1.27 131.83,1.27 133.35,2.79 133.35,48.26 132.08,49.53 2.54,49.53 1.27,48.26 1.27,2.79 2.79,1.27 7.75,1.27 8.76,2.29 8.76,27.3
  pour Top (no thermals): 38.61,31.24 39.88,31.24 39.88,39.75 39.12,39.75 32.26,32.89 35.05,30.1 38.61,30.1
  pour Top (no thermals): 29.59,36.45 29.59,32.68 26.13,32.68 26.04,32.77 26.04,36.07 26.42,36.45
  pour Top (no thermals): 36.7,39.75 33.15,36.2 31.75,36.2 31.37,35.81 31.37,35.05 32.26,34.16 32.26,32.77 34.92,30.1 36.45,30.1 37.59,31.24 39.88,31.24 39.88,39.75
  pour 5v (no thermals): 96.52,22.86 96.52,21.72 95.12,20.32 92.84,20.32 92.33,19.81 92.33,18.29 92.96,17.65 95.63,17.65 96.39,16.89 96.39,16.13 96.77,15.75 97.92,15.75 98.04,15.88 98.04,22.73 97.66,23.11 96.77,23.11
  pour Top (no thermals): 39.37,33.02 39.88,32.51 40.39,32.51 40.64,32.26 40.64,30.48 40.39,30.23 40.26,30.23 39.88,30.23 39.75,30.35 39.75,32 39.12,32.64 39.12,32.77
AUX  (via drill 0.35)
  Top 0.152: IC1.13 101.25,8.89
  Top 0.61: v83.69,12.45 83.82,12.32 83.82,9.14 88.52,4.45 95.76,4.45 100.2,8.89
  Top 1.27: 100.2,8.89 IC1.13 100.33,8.89
  Bottom 0.305: v83.69,12.45 74.93,12.45 73.66,11.18 73.66,10.79
  Bottom 1.27: JP2.5 73.66,10.79
BAT+  (via drill 0.35)
  Top 0.305: 17.93,31.75 R18.2 17.93,34.01 v17.91,34.04 | IC3.2 IC3.3
  Top 0.813: PTC1.1 87.63,15.07 v87.63,16.76
  Top 1.016: PTC2.2 89.88,31.5 v88.27,31.5
  5v 0.813: JP6.1 22.73,29.21 v17.91,34.04
  other vias: 44.7,26.16 46.61,26.16
  pour 5v (isolate 0.406): 57.15,30.48 38.1,30.48 38.1,1.27 46.99,1.27 57.15,11.43
  pour 5v (isolate 0.406): 17.78,30.48 73.66,30.48 74.93,31.75 85.09,31.75 88.27,34.92 91.44,34.92 91.44,31.75 88.9,29.21 88.9,16.38 57.15,16.38 57.15,11.43 46.99,1.27 21.59,1.27 17.78,5.08
  pour 5v (isolate 0.406, no thermals): 90.17,34.92 90.17,15.11 86.49,15.11 85.34,16.26 58.42,16.26 57.15,14.99 57.15,11.43 46.99,1.27 21.72,1.27 15.49,7.49 15.49,28.45 17.53,30.48 73.66,30.48 74.93,31.75 85.09,31.75 88.27,34.92
  pour Top (no thermals): 40.89,29.34 42.55,29.34 42.8,29.08 46.35,29.08 46.48,29.21 46.48,31.24 46.74,31.5 47.5,31.5 47.75,31.24 47.75,30.1 50.04,27.81 50.04,24.89 49.91,24.77 44.32,24.77 42.42,26.67 42.42,27.05 41.91,27.56 40.51,27.56 40.39,27.69 40.39,28.32 40.51,28.45 40.77,28.45 40.89,28.57
BQ_OUT  (via drill 0.35)
  Top 0.305: C19.1 40.59,7.8 | R22.2 43.07,7.8 | C12.1 46.28,7.24 | 41.12,5.52 C21.1
  5v 0.813: JP6.2 38.1,24.13 41.91,20.32 41.91,9.78 v46.23,5.46
  pour Top (no thermals): 38.1,8.51 38.1,6.73 38.23,6.6 38.23,4.95 38.48,4.7 45.09,4.7 44.96,7.87 40.39,7.87 39.75,8.51
  pour Top (no thermals): 44.96,7.87 48.77,7.87 48.9,8 49.15,8.26 50.93,8.26 51.31,7.87 51.31,7.24 51.31,6.1 50.04,4.83 49.4,4.19 45.34,4.19 44.83,4.7
CLK
  Bottom 0.152: JP1.5 5.84,34.8
  Bottom 0.305: JP1.5 5.59,34.8 11.18,29.21 71.75,29.21 80.01,37.47 90.81,37.47 91.44,36.83 92.71,36.83
  Bottom 1.27: IC1.27 92.71,36.83
CONFIG_LORA
  Top 0.305: R10.1 S2.B4
  Bottom 0.305: 116.84,32.26 109.22,32.26 104.65,36.83 103.25,36.83
  Bottom 1.27: S2.B4 116.84,32.26 | IC1.2 103.25,36.83
CONFIG_STOP
  Top 0.305: R11.1 S2.B3
  Bottom 0.305: 116.84,29.72 109.22,29.72 104.65,34.29 103.12,34.29
  Bottom 1.27: S2.B3 116.84,29.72 | IC1.3 103.12,34.29
CS  (via drill 0.35)
  Top 0.305: v48.51,33.78 49.66,32.64 67.06,32.64 77.09,22.61 87.76,22.61 88.77,21.59 92.71,21.59
  Top 1.27: IC1.21 92.71,21.59
  Bottom 0.305: JP5.1 46.23,46.99 | 46.23,46.99 46.23,42.04 CS.TP | v48.51,33.78 48.51,46.1 47.62,46.99 46.23,46.99
D+  (via drill 0.35)
  Top 0.152: 123.6,10.03 AC1.1
  Top 0.305: J1.A6 125.35,9.4 124.7,10.05 AC1.1 122.16,10.05 v122.05,10.16 | J1.B6 128.03,10.4 128.52,9.91 129.54,9.91 v129.79,10.16
  Bottom 0.305: v129.79,10.16 129.54,9.91 122.3,9.91 v122.05,10.16
D-  (via drill 0.35)
  Top 0.152: AC1.2
  Top 0.305: J1.A7 125.61,9.9 124.97,10.54 AC1.2 122.68,10.54 v122.05,11.18 | J1.B7 128.03,8.9 128.52,9.4 129.54,9.4 v129.79,9.14
  Bottom 0.305: v129.79,9.14 129.54,9.4 121.67,9.4 121.28,9.78 121.28,10.41 v122.05,11.18
DAT  (via drill 0.35)
  Top 0.305: v9.78,33.66 8.38,32.26 JP1.4
  Bottom 0.305: v9.78,33.66 12.95,30.48 71.12,30.48 79.25,38.61 90.68,38.61 91.44,39.37 92.71,39.37
  Bottom 1.27: IC1.28 92.71,39.37
DEFAULT_MODE
  Top 0.305: R13.1 S2.B1
  Bottom 0.305: 116.84,24.64 109.22,24.64 104.65,29.21 103.12,29.21
  Bottom 1.27: S2.B1 116.84,24.64 | IC1.5 103.12,29.21
GND  (via drill 0.35)
  Top 0.152: C15.2 42.78,11.18 | Q4.4 37.73,12.44 v37.85,12.32 | 37.08,9.39 U1.17
  Top 0.305: 30.86,33.54 C7.1 | C18.1 41.27,6.86 v42.42,5.71
  Top 0.406: IC2.2 30.48,33.92 C7.1
  Top 1.27: C6.2 32.89,40.77 33.02,40.64
  GND 0.813: v17.65,22.86 17.65,26.8 14.22,30.23 5.71,30.23 JP1.3
  other vias: 36.96,21.08 34.42,5.21 36.32,9.65 37.34,9.65 36.32,8.64 37.34,8.64 43.94,11.43 48.26,11.56 33.66,2.92 42.42,22.35 40.51,24.38 37.72,25.91 33.53,41.02 34.67,26.16 26.92,11.43 26.42,4.32 74.55,15.11 92.33,46.1 114.3,48.13 118.11,48.01 122.05,48.01 125.86,47.88 109.86,15.88 119.63,14.22 129.79,15.37 132.46,9.65 132.46,8.13 131.32,6.73 129.79,4.06 123.19,3.68 117.73,7.24 109.22,9.27 116.33,15.11 28.57,2.54 36.32,3.17 132.46,11.3 131.06,12.45 27.94,22.61 27.94,20.32 27.94,17.78 45.72,21.97 49.15,21.72 49.53,19.56 49.53,16.76 49.53,13.59 49.78,10.03 52.83,7.49 51.69,4.19 47.5,2.79 44.07,3.56 29.08,5.33 31.37,26.04 28.19,26.04 37.34,44.96 42.55,45.09 45.09,45.21 40.01,45.21 56.9,34.04 61.85,34.04 49.66,41.78 50.04,37.59 66.8,33.91 52.45,39.24 84.33,31.75 77.6,32.77 91.69,28.07 49.78,47.37 33.78,44.58 33.53,39.12 47.37,45.09 57.15,39.24 61.59,39.37 66.55,39.24 71.5,39.24 70.74,27.3 74.04,39.12 83.31,21.21 74.04,23.88 91.82,30.73 65.15,13.21 69.85,5.97 69.72,4.06 80.9,10.29 82.93,6.1 83.82,17.65 79.5,17.65 87.88,9.02 85.98,2.92 91.57,2.16 91.19,6.48 95.25,15.62 91.82,10.41 95.89,8.64 96.01,6.73 97.66,8.26 97.16,2.29 101.47,4.32 79.25,15.11 79.12,21.21 82.93,36.2 44.07,37.59 52.07,34.16 95.12,32.89 91.95,22.99 81.41,26.29 70.36,31.62 89.03,25.27 82.42,30.1 91.82,20.32 86.61,28.07 92.08,25.27 44.83,35.94 43.94,34.42
  pour GND (isolate 0.406, no thermals): 2.54,49.53 1.27,48.26 1.27,2.54 2.54,1.27 7.62,1.27 10.16,3.81 10.16,5.08 5.08,10.16 5.08,21.59 6.99,23.5 6.99,46.35 7.62,46.99 24.13,46.99 26.67,44.45 26.67,40.64 25.4,39.37 25.4,11.43 20.32,6.35 20.32,2.54 21.59,1.27 132.08,1.27 133.35,2.54 133.35,48.26 132.08,49.53
  pour Top (rank 2, no thermals): 2.54,49.53 1.27,48.26 1.27,2.54 2.54,1.27 54.61,1.27 131.95,1.14 133.48,2.67 133.48,47.75 131.7,49.53 25.78,49.53 25.02,48.77 25.02,47.88 24,46.86 21.21,46.86 19.05,44.7 19.05,42.04 20.83,40.26 24.26,40.26 25.65,41.66 25.65,48.39 26.54,49.28 31.11,49.28 32.38,48.01 32.38,37.47 33.15,37.47 36.07,40.39 40.77,40.39 41.27,39.88 41.27,32 48.13,32 48.51,31.62 48.51,30.1 50.55,28.07 50.55,24.77 50.04,24.26 43.85,24.26 41.45,27.05 40.01,27.05 38.35,28.7 38.35,29.59 28.19,29.59 25.15,32.64 25.15,39.88 24.96,39.62 20.57,39.62 18.29,41.91 18.29,44.86 21.07,47.5 24,47.5 24.51,48.01 24.51,49.02 25.02,49.53
  pour Top (no thermals): 30.73,33.66 30.23,33.15 30.23,32.51 29.59,31.88 24.89,31.88 23.43,30.42 27.05,26.8 34.16,26.8 35.18,27.81 35.18,29.46 34.67,29.46 31.5,32.64 31.5,32.89
  pour Bottom (isolate 0.406, no thermals): 2.54,49.53 1.27,48.26 1.27,2.54 2.54,1.27 132.08,1.27 133.35,2.54 133.35,48.26 132.08,49.53
  pour Top (no thermals): 41.27,32 41.4,31.88 41.4,30.73 41.4,30.48 41.66,30.48 42.29,30.48 42.42,30.61 42.42,32 42.8,32 42.93,32.13 42.93,32.38 42.8,32.51 41.4,32.51 41.27,32.38
GND_2  (via drill 0.35)
  Top 0.152: C11.2 14.45,28.13 U$1.6 | v14.35,22.09 v14.35,22.1
  Top 0.406: Q3.1 v14.35,22.09
  other vias: 12.83,27.3
  pour GND (isolate 0.813, no thermals): 19.05,11.43 16.51,8.89 10.16,8.89 8.89,10.16 8.89,36.83 11.43,39.37 20.32,39.37 20.32,22.23 19.05,20.95
  pour Top (isolate 0.254, no thermals): 12.57,37.34 11.3,36.07 11.3,27.69 12.32,26.67 18.16,26.67 20.32,28.83 20.32,35.69 18.67,37.34
M1
  Top 0.61: 66.04,11.43 66.04,12.32 69.85,16.13 79.76,16.13 82.42,13.46 82.42,8.89 87.76,3.56 97.06,3.56 99.85,6.35 100.33,6.35
  Top 1.27: JP2.2 66.04,11.43 | IC1.14 100.33,6.35
MCLR  (via drill 0.35)
  Top 0.152: R8.1 96.59,42.83
  Top 0.305: v91.06,43.18 92.68,43.18 C9.2 96.21,43.21 R8.1 R9.2
  Bottom 0.305: JP1.1 3.3,24.64 2.54,25.4 2.54,35.56 3.81,36.83 9.65,36.83 14.14,32.34 69.17,32.34 77.09,40.26 88.01,40.26 90.93,43.18 v91.06,43.18
N$1
  Top 0.305: J1.A5 127.24,8.38 124.71,8.38 124.08,7.75 R1.2
N$2
  Top 0.152: 114.79,8.24 R4.2
  Top 0.305: Q1.1 113.62,8.22 R4.2
N$3  (via drill 0.35)
  Top 0.152: C3.1 122.27,5.21 | 119.55,5.21 119.53,5.23 D1.2 119.51,5.25 119.51,5.08 | 119.45,3.11 v119.51,3.17
  Top 0.406: J1.A4 125.22,7.25 C26.2 123.3,6.24 C3.1 119.66,5.24 119.51,5.08 | PWR_USB.TP R3.2 123.63,16.2 v124.71,15.11 125.98,13.84 125.98,12.45 126.38,12.05 J1.B4
  Top 0.813: 119.71,5.41 119.53,5.23 | D1.2 119.42,3.26 v119.51,3.17
  Bottom 0.813: v119.51,3.17 119.51,11.68 120.78,12.95 123.95,12.95 124.71,13.72 v124.71,15.11
N$4
  Top 0.152: R2.1 123.51,13.72
  Top 0.305: J1.B5 126.01,11.4 124.97,12.45 124.97,13.08 124.33,13.72 R2.1
N$6
  Top 0.406: R3.1 121.1,18.03 120.44,17.37 D2.2
N$7
  Top 0.305: AC1.10 118.51,10.05 118.01,9.55 C1.1
N$8
  Top 0.305: Q2.1 114.81,14.14 R5.2
N$9  (via drill 0.35)
  Top 0.305: R17.1 v125.73,34.67
  Bottom 0.305: 102.87,19.05 104.14,19.05 106.68,21.59 119.13,21.59 122.17,24.64 122.17,32 124.84,34.67 v125.73,34.67
  Bottom 1.27: IC1.9 102.87,19.05
N$10  (via drill 0.35)
  Top 0.305: R16.1 v121.92,36.58
  Bottom 0.305: 102.87,16.51 104.14,16.51 107.44,19.81 126.11,19.81 128.4,22.1 128.4,34.67 127.51,35.56 122.78,35.56 121.92,36.42 v121.92,36.58
  Bottom 1.27: IC1.10 102.87,16.51
N$11
  Top 0.305: Q1.3 112.01,4.94 R6.1
N$12  (via drill 0.35)
  Top 0.152: v116.33,46.1 116.2,45.97 116.33,45.85
  Top 0.305: v116.33,46.1 116.33,39.62 117.34,38.62 R15.1
  Bottom 0.152: v116.33,46.1 116.2,45.97
  Bottom 0.305: v116.33,46.1 113.41,43.18 101.6,43.18 99.06,40.64 99.06,14.89 99.98,13.97 100.33,13.97
  Bottom 1.27: IC1.11 100.33,13.97
N$13  (via drill 0.35)
  Top 0.305: v112.78,46.23 112.78,39.12 113.28,38.61 114.29,38.61 R14.1
  Bottom 0.152: 112.78,46.35 v112.78,46.23
  Bottom 0.305: v112.78,46.23 110.74,48.26 100.33,48.26 96.52,44.45 96.52,14.13 99.22,11.43 100.33,11.43
  Bottom 1.27: IC1.12 100.33,11.43
N$14
  Top 0.305: Q2.3 R7.1
N$15
  Top 0.152: R6.2 110.58,4.88
  Top 0.305: D3.1 109.98,7.49 110.63,6.85 R6.2
N$16
  Top 0.305: D4.1 109.18,11.56 R7.2
N$17
  Top 0.305: R8.2 100.71,42.8 101.76,41.75 101.76,40.64
  Top 1.27: IC1.1 101.76,40.64
N$18
  Top 0.152: U$1.1 14.14,25.23 | 14.14,20.32 Q3.2
  Top 0.406: U$1.1 13.34,24.41 13.34,20.95 13.96,20.32 Q3.2
N$19
  Top 0.305: D5.2 R14.2
N$20
  Top 0.305: D6.2 R15.2
N$21
  Top 0.305: D7.2 R16.2
N$22
  Top 0.305: D8.2 R17.2
N$23
  Top 0.152: 15.09,29.92 C11.1
  Top 0.406: R18.1 15.09,29.92 | C11.1 15.01,29.44 15.24,29.21 U$1.5
N$24
  Top 0.406: Q3.5 17.91,20.32 18.8,21.21 18.8,24.77 18.19,25.37 U$1.3
N$25
  Top 0.406: Q3.3 14.97,19.67 15.24,19.94 15.24,20.57 15.63,20.97 Q3.6
N$26
  Top 0.305: C20.2 34.54,11.05 35.15,10.45 U1.1 | 33.38,13.2 32.99,13.59 R23.1
  pour Top (no thermals): 35.43,9.78 32.89,9.78 32.64,10.03 32.64,10.16 32.64,12.45 32.38,12.7 31.62,12.7 31.24,13.08 31.24,13.21 31.24,14.48 31.62,14.86 33.66,14.86 34.04,14.48 34.04,14.35 34.04,12.19 35.56,10.67 35.56,9.91
N$27
  Top 0.406: U$1.2 15.24,24.25 R19.2
N$28  (via drill 0.35)
  Top 0.152: U1.14 37.07,10.84 | Q4.1 35.9,14.91
  Top 0.305: U1.14 37.08,14.22 36.44,14.87 Q4.1 35.48,14.86 35.18,14.55 35.18,13.89 35.48,13.59 Q4.3
  Top 0.406: C16.1 v35.18,17.65 35.18,15.63 Q4.1
  Top 0.813: v39.12,16 40.55,16 L1.1
  Bottom 0.813: v35.18,17.65 36.83,16 v39.12,16
N$29
  Top 0.305: U1.10 40.16,8.89 C19.2 | C19.2 40.64,8.79 C17.1 | C19.2 42.26,8.41 42.93,9.08 R22.1
  Top 0.813: R22.1 46.31,11.71 L1.2
N$30  (via drill 0.35)
  Top 0.152: U1.6 36.57,7.45
  Top 0.305: U1.7 36.83,7.46 | 36.83,7.46 U1.6 | R25.2 R24.2 10.29,15.61 v11.3,14.61 | v29.46,7.11 R28.1 30.74,4.93 C14.1 31.61,4.06 35.18,4.06 36.83,5.71 36.83,7.46
  Bottom 0.305: v11.3,14.61 11.43,14.48 11.43,11.43 15.75,7.11 v29.46,7.11
N$31
  Top 0.305: U1.2 26.45,9.39 R27.2 25.31,8.32 R29.1
N$32
  Top 0.152: R30.1 33.01,7.11
  Top 0.305: R28.2 R30.1 33.9,7.1 34.42,7.62 34.42,7.99 34.82,8.39 U1.4
N$33  (via drill 0.35)
  Top 0.152: U1.16 36.07,10.84
  Top 0.305: U1.16 36.08,11.54 v35.31,12.32
  Top 0.406: C16.2 35.18,20.45 34.92,20.7
  Top 0.813: 34.92,20.7 34.76,20.87 D10.1 v31.75,18.8
  Bottom 0.305: v31.75,18.8 31.7,18.75 31.7,15.92 v35.31,12.32
N$34
  Top 0.305: U1.8 37.58,6.88 R21.1 37.85,5.07 R20.2 39.12,4.06 39.75,3.43 40.73,3.43 C21.2
N$35
  Top 0.305: R23.2 29.62,22 30.48,22.86 38.1,22.86 38.99,21.97 38.99,17.4 38.68,17.09 C13.1 37.73,16.83 Q4.6
  Top 0.813: D9.1 24.34,13.59 R23.2
N$36
  Top 0.813: X1.1 8.32,7.96 13.34,2.95 R26.2 18.1,2.95 D9.2 21.57,6.42 R29.2 SOLAR+.TP
N$37
  Top 0.813: C22.1 11.37,8.74 R26.1
N$38
  Top 0.152: 4.92,14.61 D11.2
  Top 0.305: R24.1 D11.2
N$39
  Top 0.152: R25.1 | 5.04,18.29 D12.2
  Top 0.305: D12.2 8.88,18.41 R25.1
N$40  (via drill 0.35)
  Top 0.305: U1.3 34.17,8.89 v33.4,8.13 | v3.68,16.26 3.21,15.79 D11.1
  Bottom 0.305: v33.4,8.13 27.56,13.97 17.78,13.97 15.49,16.26 v3.68,16.26
N$41  (via drill 0.35)
  Top 0.305: D12.1 3.21,19.47 v3.81,20.07 | U1.5 36.08,6.95 35.86,6.73 v34.67,6.73
  Bottom 0.152: v3.81,20.07 3.86,20.02
  Bottom 0.305: v3.81,20.07 14.48,20.07 18.92,15.62 28.83,15.62 34.67,9.78 v34.67,6.73
N$42  (via drill 0.35)
  Top 0.152: U1.12 38.53,9.91
  Top 0.305: D10.2 31.79,16.51 | U1.12 39.1,9.89 v39.5,10.29 40.51,11.3 C15.1
  Top 0.813: v33.66,16.51 33.61,16.47 D10.2
  Bottom 0.813: v39.5,10.29 39.5,12.95 38.1,14.35 35.69,14.35 33.66,16.38 v33.66,16.51
N$43
  Top 0.152: U1.15 36.57,10.84
  Top 0.305: U1.15 36.58,13.71 36.56,13.73 36.56,13.9 36.24,14.22 Q4.2
N$44
  Top 0.305: Q4.5 38.23,14.22 38.61,13.84 38.61,11.3 38.13,10.83 U1.13
N$45
  Top 0.813: U2.1 86.11,14.9 PTC1.2
N$46
  Top 0.813: U3.1 89.11,35.56 PTC2.1
N$47
  Top 0.305: IC3.5 41.02,30.3 41.27,30.06 44.07,30.06 L2.2
N$48
  Top 0.305: R31.1 39.36,28.83 40.34,28.83 IC3.1
  Top 0.406: R31.1 R32.2
RST
  GND 0.305: JP5.7 30.99,45.47 35.81,40.64 76.2,40.64 83.69,33.15 92.42,33.15 IC1.25
RX1
  Top 0.305: 71.12,6.99 RX_LORA.TP
  Top 1.27: JP2.4 71.12,6.99
  Bottom 0.305: 92.2,8.89 89.92,8.89 88.52,10.29 88.52,12.95 87.5,13.97 73.66,13.97 71.12,11.43 71.12,10.92
  Bottom 1.27: IC1.16 92.2,8.89 | JP2.4 71.12,10.92
RX2  (via drill 0.35)
  Top 0.152: IC1.18 93.82,13.96
  Top 0.305: 92.71,13.97 RX_USB.TP | 95.25,13.97 95.89,13.97 97.16,12.7 103.5,12.7 v104.39,11.81 | R5.1 115.41,11.81 v116.46,11.81 117.23,11.04 118.45,11.04 118.46,11.05 AC1.8
  Top 1.27: 95.25,13.97 IC1.18 92.71,13.97
  Bottom 0.305: v116.46,11.81 v104.39,11.81
SCK1
  Top 0.305: JP5.2 43.69,45.22 50.94,37.97 79.76,37.97 82.68,35.05 82.68,31.75 85.22,29.21 92.71,29.21
  Top 1.27: 92.71,29.21 IC1.24
  Bottom 0.305: JP5.2 SCK.TP
SDI1  (via drill 0.35)
  Top 0.305: JP5.4 38.61,45.21 48.39,35.43 78.23,35.43 79.5,34.16 v79.5,32 79.5,31.88
  Top 1.27: IC1.23 92.71,26.67
  Bottom 0.305: JP5.4 38.61,43.05 SDI.TP | v79.5,32 79.5,30.73 83.57,26.67 92.71,26.67
  Bottom 1.27: IC1.23 92.71,26.67
SDO1
  Top 0.305: JP5.3 41.15,44.96 49.4,36.7 78.99,36.7 81.15,34.54 81.15,29.34 86.36,24.13 IC1.22
  Bottom 0.305: JP5.3 41.15,43.31 SDO.TP
TEST
  Top 0.305: R12.1 S2.B2
  Bottom 0.305: 116.84,27.18 109.22,27.18 104.65,31.75 103,31.75
  Bottom 1.27: S2.B2 116.84,27.18 | IC1.4 103,31.75
TX1
  Top 0.305: 68.58,6.99 TX_LORA.TP
  Top 1.27: JP2.3 68.58,6.99
  GND 0.305: JP2.3 68.58,11.8 73.09,16.31 85.64,16.31 89.25,12.7 89.25,10.92 IC1.15
TX2  (via drill 0.35)
  Top 0.152: 116.42,10.32 v116.46,10.29
  Top 0.305: 92.71,11.43 TX_USB.TP | R4.1 115.28,10.29 v116.46,10.29 117.09,10.29 117.36,10.55 AC1.9
  Top 1.27: IC1.17 92.71,11.43
  Bottom 0.305: v116.46,10.29 98.04,10.29 96.9,11.43 95.25,11.43
  Bottom 1.27: IC1.17 95.25,11.43

### Text on the board
tNames: RFID | Carregar Firmware | P1 P2 P3 P4 | Configs | SOLAR | CHARGED | PWR_USB | CHARGIND | RX_USB | TX_USB | LoRa
bNames: By: Ivo Azevedo | - | + | - | +